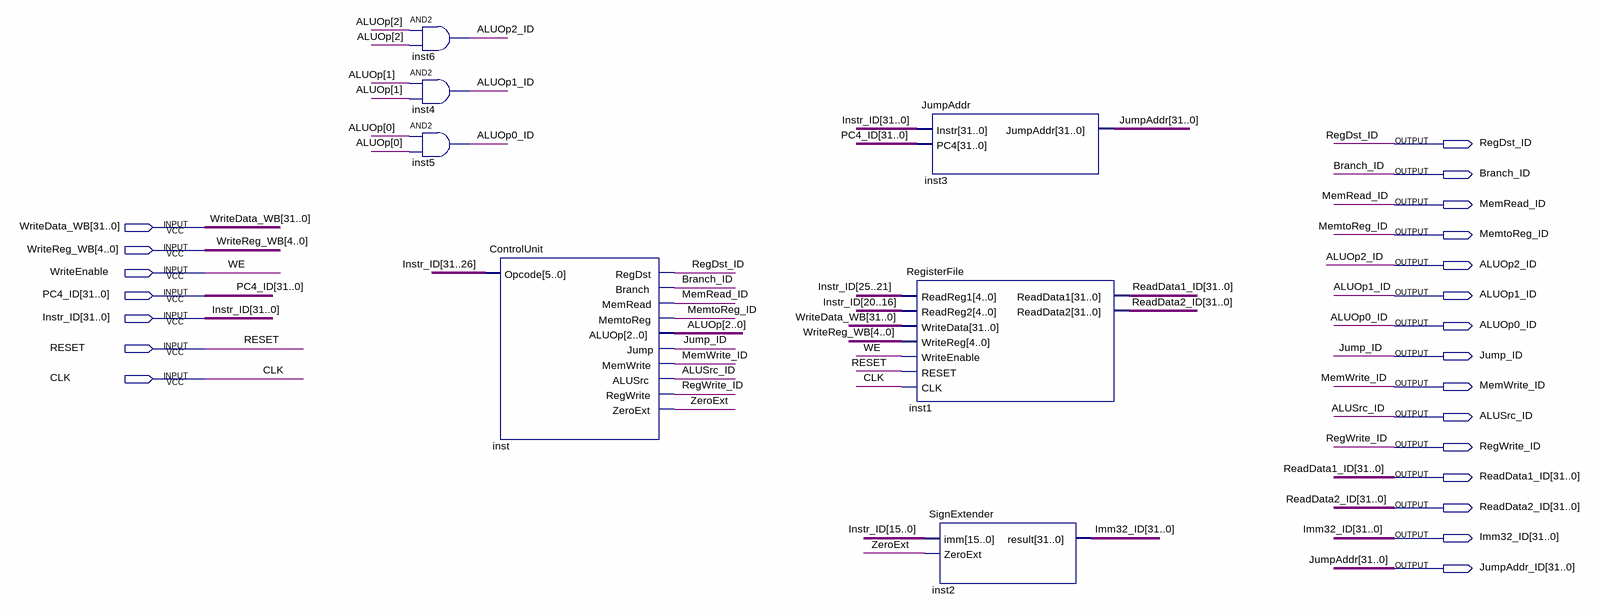
[diagram p0: schematic sheet]
// Quartus schematic ID_Stage.bdf as structural Verilog: 7 symbols, 22 pins
module ID_Stage (
  input  [31:0] WriteData_WB,
  input  [4:0] WriteReg_WB,
  input  WriteEnable,
  input  [31:0] PC4_ID,
  input  [31:0] Instr_ID,
  input  RESET,
  input  CLK,
  output RegDst_ID,
  output Branch_ID,
  output MemRead_ID,
  output MemtoReg_ID,
  output ALUOp2_ID,
  output ALUOp1_ID,
  output ALUOp0_ID,
  output Jump_ID,
  output MemWrite_ID,
  output ALUSrc_ID,
  output RegWrite_ID,
  output [31:0] ReadData1_ID,
  output [31:0] ReadData2_ID,
  output [31:0] Imm32_ID,
  output [31:0] JumpAddr_ID
);

  wire ZeroExt;
  wire [2:0] ALUOp;

  and inst6 (ALUOp2_ID, ALUOp[2], ALUOp[2]);
  and inst4 (ALUOp1_ID, ALUOp[1], ALUOp[1]);
  and inst5 (ALUOp0_ID, ALUOp[0], ALUOp[0]);
  ControlUnit inst (
    .Opcode(Instr_ID[31:26]), .RegDst(RegDst_ID), .Branch(Branch_ID), .MemRead(MemRead_ID),
    .MemtoReg(MemtoReg_ID), .ALUOp(ALUOp), .Jump(Jump_ID), .MemWrite(MemWrite_ID), .ALUSrc(ALUSrc_ID),
    .RegWrite(RegWrite_ID), .ZeroExt(ZeroExt));
  RegisterFile inst1 (
    .ReadReg1(Instr_ID[25:21]), .ReadReg2(Instr_ID[20:16]), .WriteData(WriteData_WB), .WriteReg(WriteReg_WB),
    .WriteEnable(WriteEnable), .RESET(RESET), .CLK(CLK), .ReadData1(ReadData1_ID), .ReadData2(ReadData2_ID));
  JumpAddr inst3 (.Instr(Instr_ID), .PC4(PC4_ID), .JumpAddr(JumpAddr_ID));
  SignExtender inst2 (.imm(Instr_ID[15:0]), .ZeroExt(ZeroExt), .result(Imm32_ID));

  // Other names for the same wires on the sheet: JumpAddr[31:0] = JumpAddr_ID; WE = WriteEnable
endmodule
